# EAGLE design ide1-a (EAGLE 4.13)
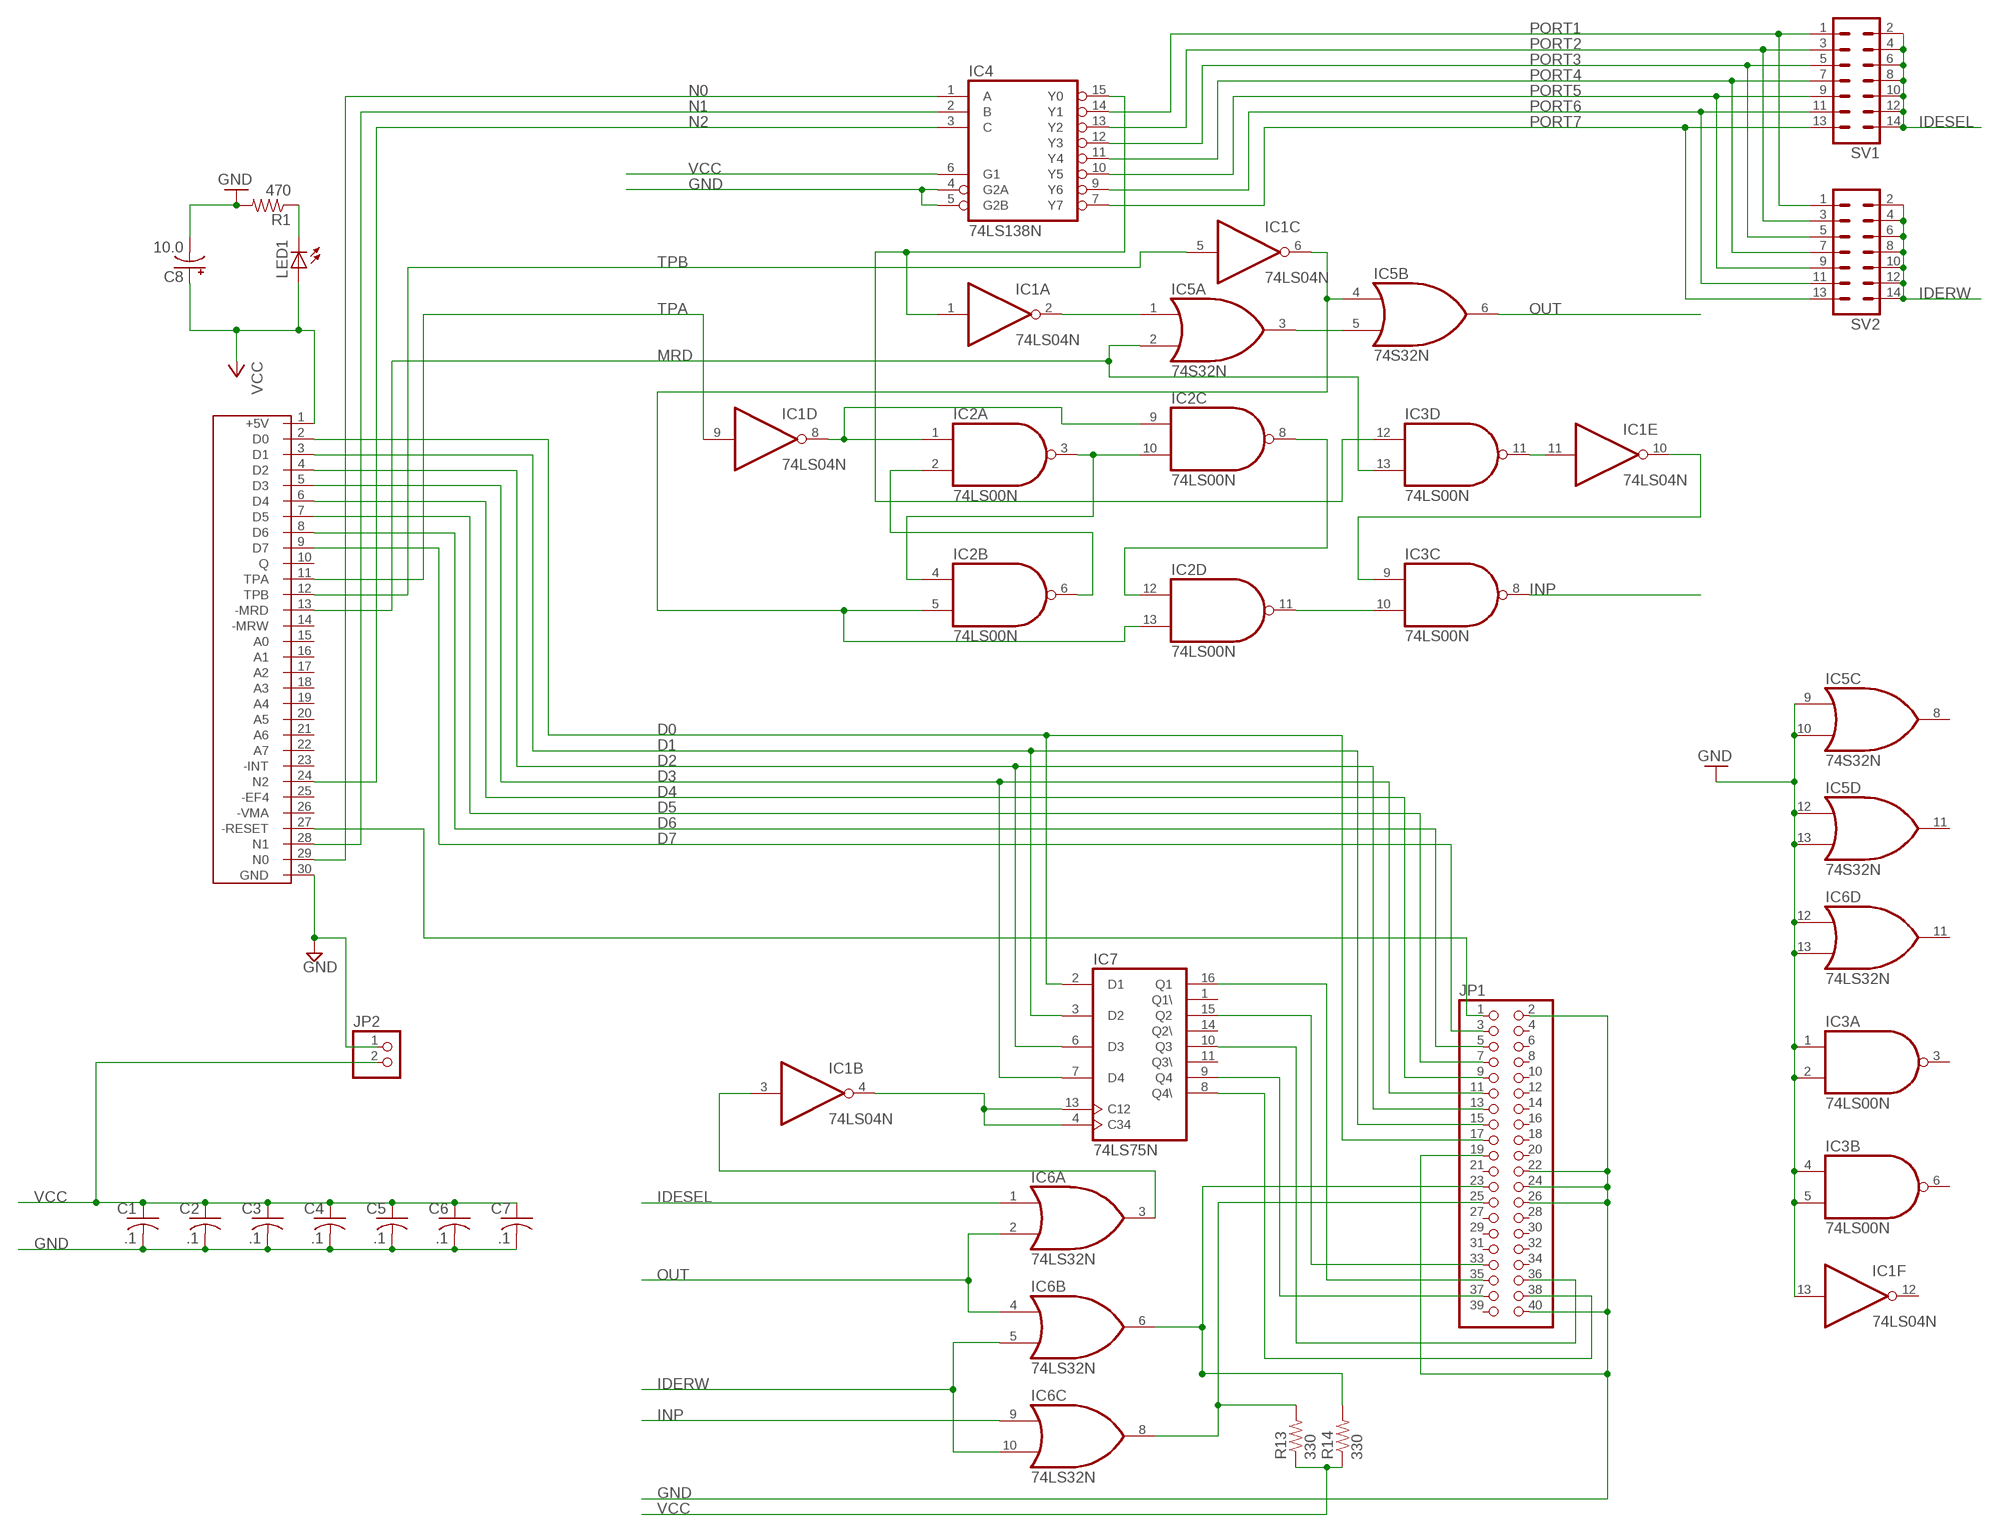
[diagram p0: schematic, sheet 1]

## Parts
C1  .1  C-US025-050X050  [C025-050X050]
C2  .1  C-US025-050X050  [C025-050X050]
C3  .1  C-US025-050X050  [C025-050X050]
C4  .1  C-US025-050X050  [C025-050X050]
C5  .1  C-US025-050X050  [C025-050X050]
C6  .1  C-US025-050X050  [C025-050X050]
C7  .1  C-US025-050X050  [C025-050X050]
C8  10.0  CPOL-USE2.5-7  [E2,5-7]
IC1  74LS04N  [DIL14]
IC2  74LS00N  [DIL14]
IC3  74LS00N  [DIL14]
IC4  74LS138N  [DIL16]
IC5  74S32N  [DIL14]
IC6  74LS32N  [DIL14]
IC7  74LS75N  [DIL16]
JP1  PINHD-2X20  [2X20]
JP2  PINHD-1X2  [1X02]
LED1  LED5MM  [LED5MM]
R1  470  R-US_0207/7  [0207/7]
R13  330  R-US_0207/7  [0207/7]
R14  330  R-US_0207/7  [0207/7]
SV1  MA07-2  [MA07-2]
SV2  MA07-2  [MA07-2]
U$1  C30  [C30]

## Nets
D0: IC7.2(D1) JP1.17 U$1.2(D0)
D1: IC7.3(D2) JP1.15 U$1.3(D1)
D2: IC7.6(D3) JP1.13 U$1.4(D2)
D3: IC7.7(D4) JP1.11 U$1.5(D3)
D4: JP1.9 U$1.6(D4)
D5: JP1.7 U$1.7(D5)
D6: JP1.5 U$1.8(D6)
D7: JP1.3 U$1.9(D7)
GND: C1.2 C2.2 C3.2 C4.2 C5.2 C6.2 C7.2 C8.- IC1.13(F:I) IC3.1(A:I0) IC3.2(A:I1) IC3.4(B:I0) IC3.5(B:I1) IC4.4(G2A) IC4.5(G2B) IC5.9(C:I0) IC5.10(C:I1) IC5.12(D:I0) IC5.13(D:I1) IC6.12(D:I0) IC6.13(D:I1) JP1.2 JP1.19 JP1.22 JP1.24 JP1.26 JP1.40 JP2.1 R1.2 U$1.30(GND)
IDERW: IC6.5(B:I1) IC6.10(C:I1) SV2.2 SV2.4 SV2.6 SV2.8 SV2.10 SV2.12 SV2.14
IDESEL: IC6.1(A:I0) SV1.2 SV1.4 SV1.6 SV1.8 SV1.10 SV1.12 SV1.14
INP: IC3.8(C:O) IC6.9(C:I0)
MRD: IC3.13(D:I1) IC5.2(A:I1) U$1.13(-MRD)
N0: IC4.1(A) U$1.29(N0)
N1: IC4.2(B) U$1.28(N1)
N2: IC4.3(C) U$1.24(N2)
N$6: IC1.1(A:I) IC3.12(D:I0) IC4.15(Y0)
N$7: IC1.2(A:O) IC5.1(A:I0)
N$8: IC2.3(A:O) IC2.4(B:I0) IC2.10(C:I1)
N$9: IC5.3(A:O) IC5.5(B:I1)
N$10: IC1.6(C:O) IC2.5(B:I1) IC2.13(D:I1) IC5.4(B:I0)
N$11: IC2.2(A:I1) IC2.6(B:O)
N$12: IC1.8(D:O) IC2.1(A:I0) IC2.9(C:I0)
N$13: IC1.10(E:O) IC3.9(C:I0)
N$14: IC2.8(C:O) IC2.12(D:I0)
N$15: IC1.3(B:I) IC6.3(A:O)
N$16: IC2.11(D:O) IC3.10(C:I1)
N$17: IC1.11(E:I) IC3.11(D:O)
N$22: LED1.K(C) R1.1
N$23: IC1.4(B:O) IC7.4(C34) IC7.13(C12)
N$24: IC7.16(Q1) JP1.35
N$25: IC7.15(Q2) JP1.33
N$26: IC7.10(Q3) JP1.36
N$27: IC7.9(Q4) JP1.37
N$28: IC7.8(Q4\) JP1.38
N$29: IC6.6(B:O) JP1.23 R14.2
N$30: IC6.8(C:O) JP1.25 R13.2
OUT: IC5.6(B:O) IC6.2(A:I1) IC6.4(B:I0)
PORT1: IC4.14(Y1) SV1.1 SV2.1
PORT2: IC4.13(Y2) SV1.3 SV2.3
PORT3: IC4.12(Y3) SV1.5 SV2.5
PORT4: IC4.11(Y4) SV1.7 SV2.7
PORT5: IC4.10(Y5) SV1.9 SV2.9
PORT6: IC4.9(Y6) SV1.11 SV2.11
PORT7: IC4.7(Y7) SV1.13 SV2.13
RESET: JP1.1 U$1.27(-RESET)
TPA: IC1.9(D:I) U$1.11(TPA)
TPB: IC1.5(C:I) U$1.12(TPB)
VCC: C1.1 C2.1 C3.1 C4.1 C5.1 C6.1 C7.1 C8.+ IC4.6(G1) JP2.2 LED1.A R13.1 R14.1 U$1.1(+5V)
Unconnected: IC1.12(F:O) IC3.3(A:O) IC3.6(B:O) IC5.8(C:O) IC5.11(D:O) IC6.11(D:O) IC7.1(Q1\) IC7.11(Q3\) IC7.14(Q2\) JP1.4 JP1.6 JP1.8 JP1.10 JP1.12 JP1.14 JP1.16 JP1.18 JP1.20 JP1.21 JP1.27 JP1.28 JP1.29 JP1.30 JP1.31 JP1.32 JP1.34 JP1.39 U$1.10(Q) U$1.14(-MRW) U$1.15(A0) U$1.16(A1) U$1.17(A2) U$1.18(A3) U$1.19(A4) U$1.20(A5) U$1.21(A6) U$1.22(A7) U$1.23(-INT) U$1.25(-EF4) U$1.26(-VMA)

## Power pins joined to a net without a drawn wire
GND: IC1.7(P:GND) IC2.7(P:GND) IC3.7(P:GND) IC4.8(GND) IC5.7(P:GND) IC6.7(P:GND) IC7.12(GND)
VCC: IC1.14(P:VCC) IC2.14(P:VCC) IC3.14(P:VCC) IC4.16(VCC) IC5.14(P:VCC) IC6.14(P:VCC) IC7.5(VCC)

## Library data of the parts
C1-C7 = rcl:C-US: CAPACITOR, American symbol
C8 = rcl:CPOL-US: POLARIZED CAPACITOR, American symbol
IC1 = 74xx-us:74*04: Hex INVERTER
IC2 IC3 = 74xx-us:74*00: Quad 2-input NAND gate
IC4 = 74xx-us:74*138: 3-line to 8-line DECODER/DEMULTIPLEXER
IC5 IC6 = 74xx-us:74*32: Quad 2-input OR gate
IC7 = 74xx-us:74*75: 4-bit bistable LATCH
JP1 = pinhead:PINHD-2X20: PIN HEADER
JP2 = pinhead:PINHD-1X2: PIN HEADER
LED1 = led:LED: LED OSRAM: - CHIPLED LG R971, LG N971, LY N971, LG Q971, LY Q971, LO R971, LY R971 LH N974, LH R974 LS Q976, LO Q976, LY Q976 LO Q996 - Hyper CHIPLED LW Q18S LB Q993, LB Q99A, LB R99A - SideLED LS A670, LO A670, LY A670, LG A670, LP A670 LB A673, LV A673, LT A673, LW A673 LH A674 LY A675 LS A676, LA A676, LO A676, LY A676, LW A676 LS A679, LY A679, LG A679 - Hyper Micro SIDELED® LS Y876, LA Y876, LO Y876, LY Y876 LT Y87S - SmartLED LW L88C, LW L88S LB L89C, LB L89S, LG L890 LS L89K, LO L89K, LY L89K LS L896, LA L896, LO L896, LY L896 - TOPLED LS T670, LO T670, LY T670, LG T670, LP T670 LSG T670, LSP T670, LSY T670, LOP T670, LYG T670 LG T671, LOG T671, LSG T671 LB T673, LV T673, LT T673, LW T673 LH T674 LS T676, LA T676, LO T676, LY T676, LB T676, LH T676, LSB T676, LW T676 LB T67C, LV T67C, LT T67C, LS T67K, LO T67K, LY T67K, LW E67C LS E67B, LA E67B, LO E67B, LY E67B, LB E67C, LV E67C, LT E67C LW T67C LS T679, LY T679, LG T679 LS T770, LO T770, LY T770, LG T770, LP T770 LB T773, LV T773, LT T773, LW T773 LH T774 LS E675, LA E675, LY E675, LS T675 LS T776, LA T776, LO T776, LY T776, LB T776 LHGB T686 LT T68C, LB T68C - Hyper Mini TOPLED® LB M676 - Mini TOPLED Santana® LG M470 LS M47K, LO M47K, LY M47K Source: http://www.osram.convergy.de/
R1 R13 R14 = rcl:R-US_: RESISTOR, American symbol
SV1 SV2 = con-lstb:MA07-2: PIN HEADER
U$1 = k1:C30

## Board
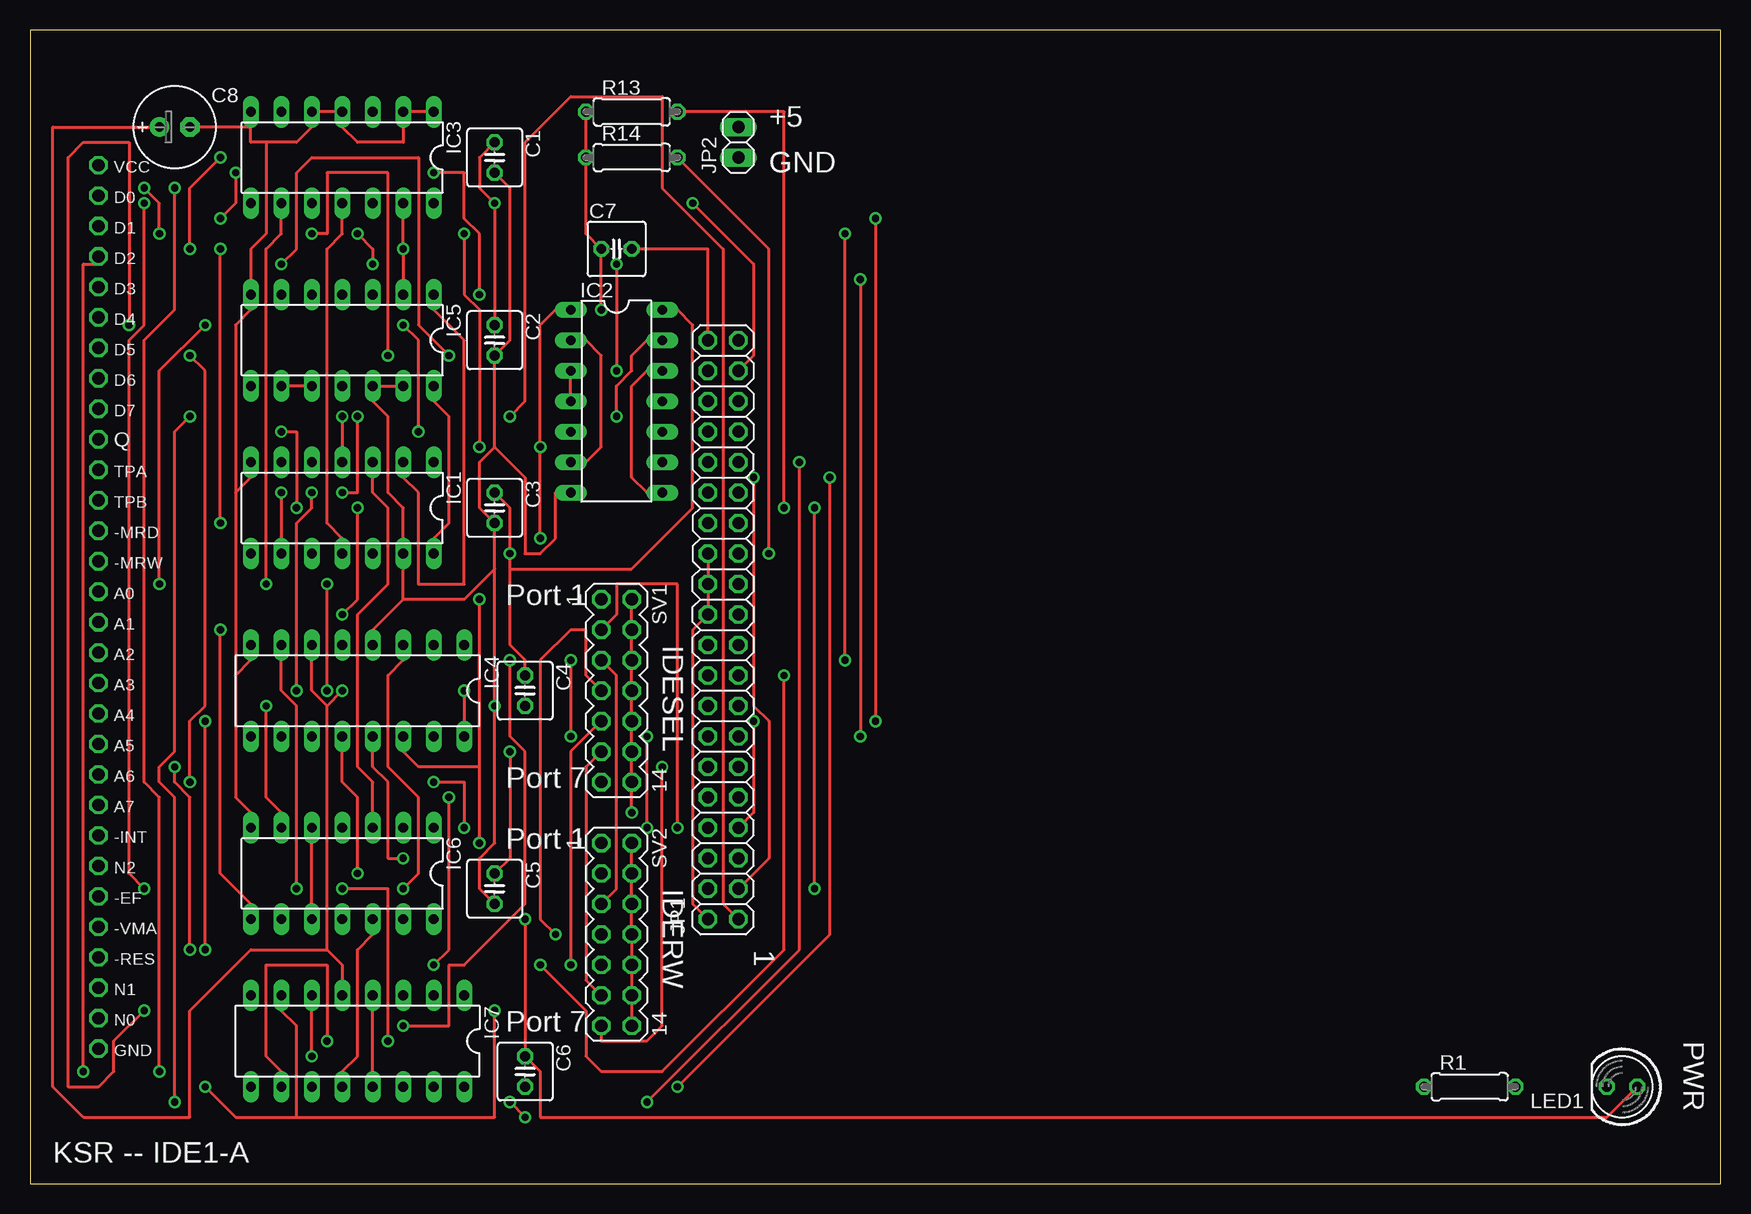
[diagram p1: board, top side]
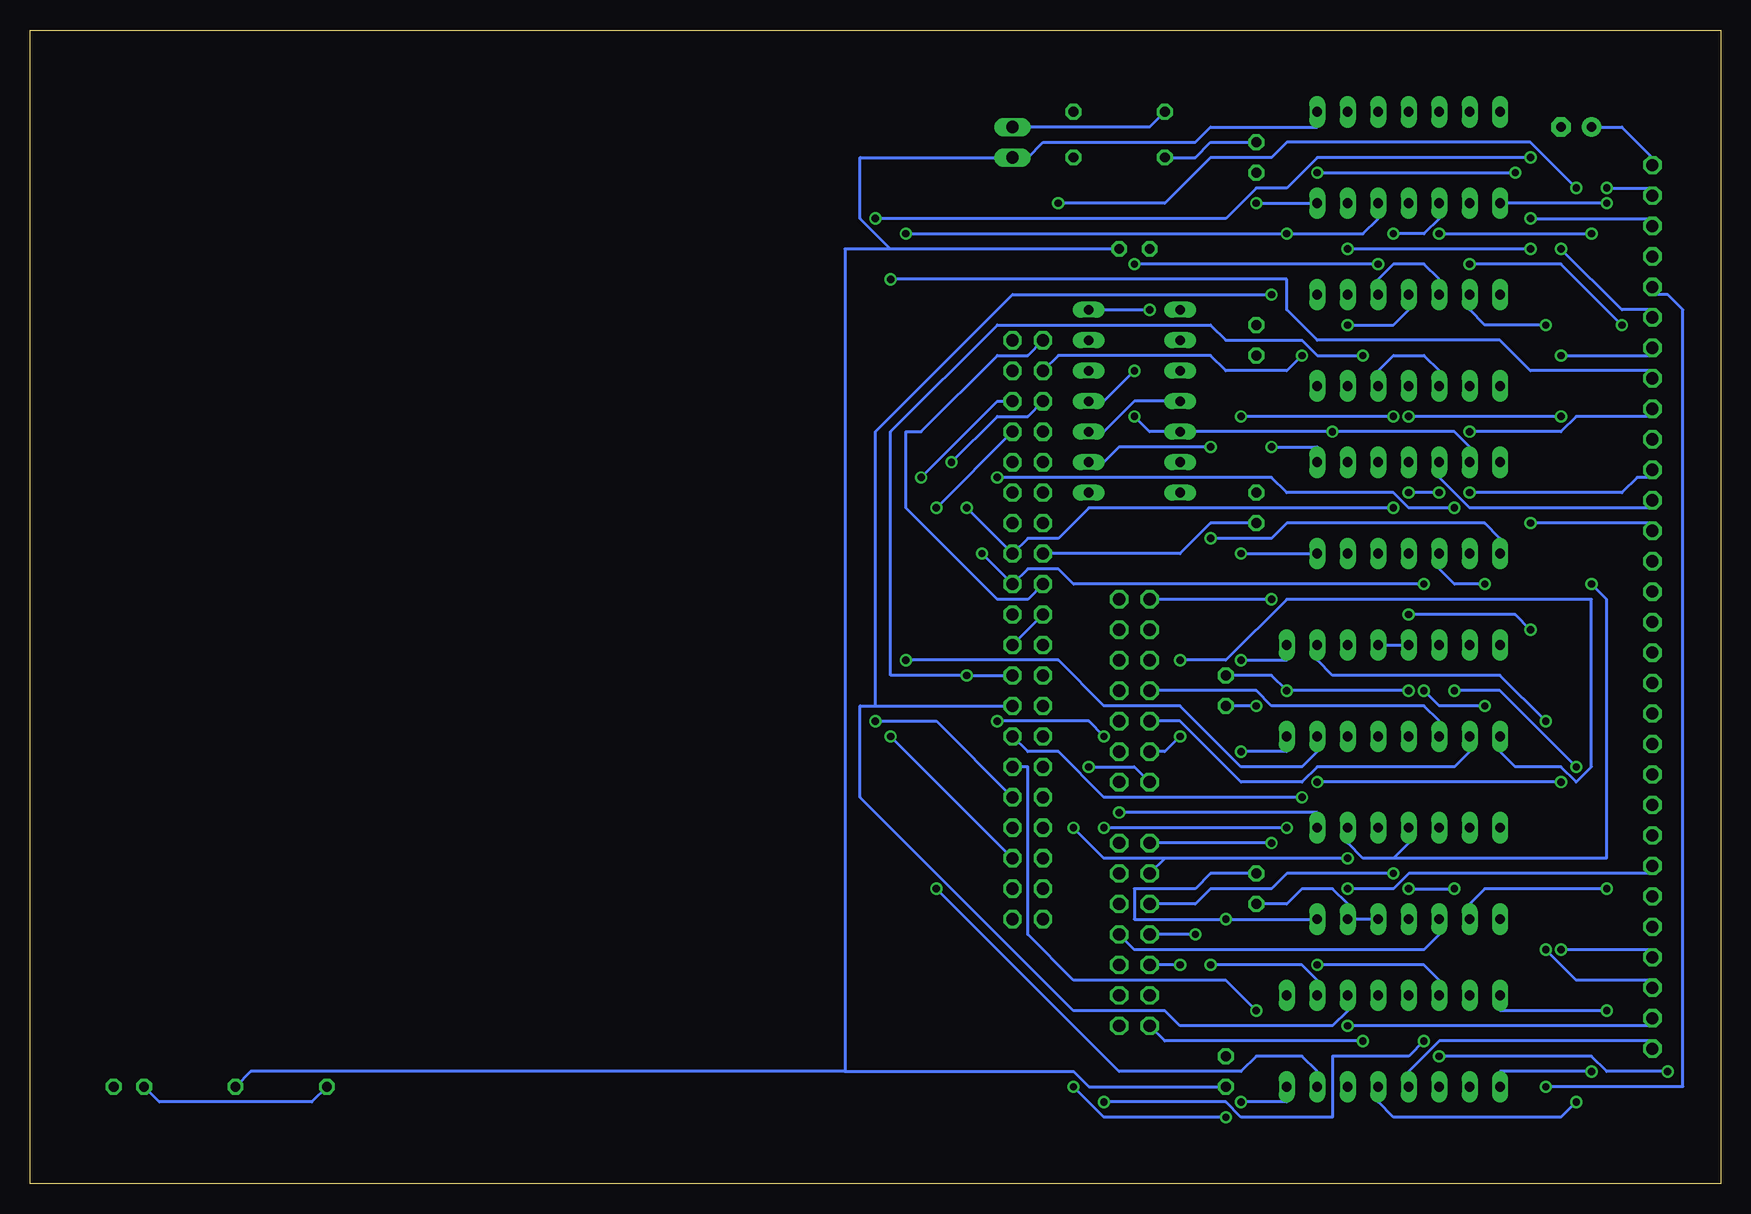
[diagram p2: board, bottom side, seen from below]

Size 140.95 x 96.19 mm. Coordinates in mm from the lower left corner, seen from the top.
Outline: 0,0 140.95,0 140.95,96.19 0,96.19 0,0
Copper layers (1*16): Top 0.035mm / dielectric 1.5mm / Bottom 0.035mm
Design rules "default": minimum track width 10mil, minimum drill 24mil, track to track 8mil, track to pad 8mil, pad to pad 8mil, via to via 8mil, smd to smd 8mil, copper to edge 40mil, drill to drill 8mil, minimum pad ring 10mil, minimum via ring 8mil, stop-mask expansion 4mil, vias tented up to drill 0mil, thermal gap 10mil
tRestrict: area 0.6,91.9 to 69.2,95.7; area 0.6,0.5 to 76.8,4.3
bRestrict: area 0.6,91.9 to 69.2,95.7; area 0.6,0.5 to 76.8,4.3

### Footprints (pad centres in the part's own frame; a part is rotated, then mirrored left to right if it is on the bottom)
C025-050X050 = drill 0.813 octagon: 1 -1.27,0; 2 1.27,0
E2,5-7 = drill 0.813 pad 1.6 round: + -1.27,0 | drill 0.813 pad 1.6 octagon: - 1.27,0
DIL14 = drill 0.813 long: 1 -7.62,-3.81; 2 -5.08,-3.81; 3 -2.54,-3.81; 4 0,-3.81; 5 2.54,-3.81; 6 5.08,-3.81; 7 7.62,-3.81; 8 7.62,3.81; 9 5.08,3.81; 10 2.54,3.81; 11 0,3.81; 12 -2.54,3.81; 13 -5.08,3.81; 14 -7.62,3.81
DIL16 = drill 0.813 long: 1 -8.89,-3.81; 2 -6.35,-3.81; 3 -3.81,-3.81; 4 -1.27,-3.81; 5 1.27,-3.81; 6 3.81,-3.81; 7 6.35,-3.81; 8 8.89,-3.81; 9 8.89,3.81; 10 6.35,3.81; 11 3.81,3.81; 12 1.27,3.81; 13 -1.27,3.81; 14 -3.81,3.81; 15 -6.35,3.81; 16 -8.89,3.81
2X20 = drill 1.016 octagon: 1 -24.13,-1.27; 2 -24.13,1.27; 3 -21.59,-1.27; 4 -21.59,1.27; 5 -19.05,-1.27; 6 -19.05,1.27; 7 -16.51,-1.27; 8 -16.51,1.27; 9 -13.97,-1.27; 10 -13.97,1.27; 11 -11.43,-1.27; 12 -11.43,1.27; 13 -8.89,-1.27; 14 -8.89,1.27; 15 -6.35,-1.27; 16 -6.35,1.27; 17 -3.81,-1.27; 18 -3.81,1.27; 19 -1.27,-1.27; 20 -1.27,1.27; 21 1.27,-1.27; 22 1.27,1.27; 23 3.81,-1.27; 24 3.81,1.27; 25 6.35,-1.27; 26 6.35,1.27; 27 8.89,-1.27; 28 8.89,1.27; 29 11.43,-1.27; 30 11.43,1.27; 31 13.97,-1.27; 32 13.97,1.27; 33 16.51,-1.27; 34 16.51,1.27; 35 19.05,-1.27; 36 19.05,1.27; 37 21.59,-1.27; 38 21.59,1.27; 39 24.13,-1.27; 40 24.13,1.27
1X02 = drill 1.016 long: 1 -1.27,0; 2 1.27,0
LED5MM = drill 0.813 octagon: A -1.27,0; K 1.27,0
0207/7 = drill 0.813 octagon: 1 -3.81,0; 2 3.81,0
MA07-2 = drill 1.016 octagon: 1 -7.62,-1.27; 2 -7.62,1.27; 3 -5.08,-1.27; 4 -5.08,1.27; 5 -2.54,-1.27; 6 -2.54,1.27; 7 0,-1.27; 8 0,1.27; 9 2.54,-1.27; 10 2.54,1.27; 11 5.08,-1.27; 12 5.08,1.27; 13 7.62,-1.27; 14 7.62,1.27
C30 = drill 1.016 octagon: 1 -36.83,0; 2 -34.29,0; 3 -31.75,0; 4 -29.21,0; 5 -26.67,0; 6 -24.13,0; 7 -21.59,0; 8 -19.05,0; 9 -16.51,0; 10 -13.97,0; 11 -11.43,0; 12 -8.89,0; 13 -6.35,0; 14 -3.81,0; 15 -1.27,0; 16 1.27,0; 17 3.81,0; 18 6.35,0; 19 8.89,0; 20 11.43,0; 21 13.97,0; 22 16.51,0; 23 19.05,0; 24 21.59,0; 25 24.13,0; 26 26.67,0; 27 29.21,0; 28 31.75,0; 29 34.29,0; 30 36.83,0

### Placement (x,y rotation side)
C1  38.73,85.56 270 top
C2  38.73,70.32 270 top
C3  38.73,56.35 270 top
C4  41.27,41.11 270 top
C5  38.73,24.6 270 top
C6  41.27,9.36 270 top
C7  48.89,77.94 0 top
C8  12.06,88.1 0 top
IC1  26.03,56.35 180 top
IC2  48.89,65.24 270 top
IC3  26.03,85.56 180 top
IC4  27.3,41.11 180 top
IC5  26.03,70.32 180 top
IC6  26.03,25.87 180 top
IC7  27.3,11.9 180 top
JP1  57.78,46.19 90 top
JP2  59.05,86.83 90 top
LED1  132.71,8.09 180 top
R1  120.01,8.09 0 top
R13  50.16,89.37 0 top
R14  50.16,85.56 0 top
SV1  48.89,41.11 270 top
SV2  48.89,20.79 270 top
U$1  5.71,48.09 270 top

### Tracks (layer width: path | path; a pad name or v marks a point on that pad's centre or on a via)
D0  (via drill 0.61)
  Top 0.254: v42.54,18.25 46.35,14.44 46.35,10.63 47.62,9.36 52.7,9.36 62.86,19.52 v62.86,42.38 | v9.52,83.02 10.79,81.75 v10.79,79.21 | v23.49,79.21 24.76,79.21 24.76,84.29 29.84,84.29 v29.84,69.05
  Bottom 0.254: v42.54,18.25 34.92,18.25 33.65,16.98 IC7.2 | JP1.17 v62.86,42.38 69.21,42.38 69.21,62.7 60.32,71.59 42.54,71.59 41.27,70.32 34.92,70.32 33.65,69.05 v29.84,69.05 | v9.52,83.02 5.71,83.02 U$1.2 | v23.49,79.21 v10.79,79.21
D1  (via drill 0.61)
  Top 0.254: v15.87,80.48 17.14,81.75 v17.14,84.29 | v33.65,84.29 36.19,84.29 36.19,80.48 37.46,79.21 v37.46,74.13
  Bottom 0.254: 70.48,39.84 JP1.15 | 70.48,39.84 71.75,39.84 71.75,32.22 53.97,14.44 46.35,14.44 45.08,13.17 32.38,13.17 31.11,14.44 IC7.3 | v15.87,80.48 5.71,80.48 U$1.3 | v33.65,84.29 v17.14,84.29 | v37.46,74.13 59.05,74.13 70.48,62.7 70.48,39.84
D2  (via drill 0.61)
  Top 0.254: v33.65,18.25 34.92,19.52 v34.92,32.22 | v4.44,9.36 4.44,76.67 5.71,76.67 U$1.4 | v23.49,10.63 IC7.6
  Bottom 0.254: v33.65,18.25 24.76,18.25 23.49,16.98 IC7.6 | v34.92,32.22 51.43,32.22 55.24,36.03 57.78,36.03 JP1.13 | v4.44,9.36 9.52,9.36 10.79,10.63 v23.49,10.63
D3  (via drill 0.61)
  Top 0.254: 22.22,5.55 22.22,13.17 20.95,14.44 IC7.7 | 22.22,5.55 38.73,5.55 v38.73,14.44 | v14.6,8.09 17.14,5.55 22.22,5.55
  Bottom 0.254: v38.73,14.44 41.27,16.98 53.97,16.98 57.78,20.79 57.78,34.76 JP1.11 | v14.6,8.09 3.17,8.09 3.17,72.86 4.44,74.13 5.71,74.13 U$1.5
D4  (via drill 0.61)
  Top 0.254: v70.48,80.48 v70.48,38.57 | v15.87,85.56 13.33,83.02 v13.33,77.94
  Bottom 0.254: JP1.9 65.4,38.57 v70.48,38.57 | v70.48,80.48 41.27,80.48 38.73,83.02 36.19,83.02 33.65,85.56 v15.87,85.56 | v13.33,77.94 8.25,72.86 5.71,72.86 U$1.6
D5  (via drill 0.61)
  Top 0.254: v13.33,69.05 14.6,67.78 14.6,39.84 13.33,38.57 v13.33,33.49 | v33.65,33.49 36.19,33.49 v36.19,29.68 | v51.43,29.68 v51.43,37.3 | v60.32,38.57 60.32,30.95 JP1.7
  Bottom 0.254: v13.33,69.05 5.71,69.05 U$1.7 | v13.33,33.49 v33.65,33.49 | v36.19,29.68 v51.43,29.68 | v51.43,37.3 52.7,38.57 v60.32,38.57
D6  (via drill 0.61)
  Top 0.254: v69.21,75.4 v69.21,37.3
  Bottom 0.254: v69.21,75.4 36.19,75.4 36.19,72.86 33.65,70.32 18.41,70.32 15.87,67.78 5.71,67.78 U$1.8 | v69.21,37.3 JP1.5
D7  (via drill 0.61)
  Top 0.254: v20.95,62.7 22.22,62.7 v22.22,56.35 | v60.32,58.89 60.32,39.84 61.59,38.57 61.59,27.14 JP1.3
  Bottom 0.254: v20.95,62.7 13.33,62.7 12.06,63.97 5.71,63.97 U$1.9 | v22.22,56.35 26.03,56.35 27.3,57.62 36.19,57.62 37.46,58.89 v60.32,58.89
GND  (via drill 0.61)
  Top 0.254: IC6.12 28.57,20.79 27.3,19.52 27.3,10.63 26.03,9.36 IC7.12 | JP1.26 JP1.24 JP1.22 55.24,46.19 55.24,23.33 JP1.2 | IC5.10 IC5.9 | IC5.13 IC5.12 28.57,65.24 29.84,63.97 29.84,57.62 31.11,56.35 IC1.13 31.11,48.73 | 31.11,48.73 28.57,46.19 IC4.4 | 38.73,61.43 37.46,60.16 37.46,56.35 C3.2 38.73,51.27 | 38.73,61.43 C2.2 40,70.32 40,83.02 C1.2 | 38.73,51.27 v38.73,39.84 38.73,28.41 37.46,27.14 37.46,24.6 C5.2 | 38.73,61.43 41.27,58.89 41.27,52.54 42.54,52.54 43.81,53.81 43.81,57.62 IC2.7 | 31.11,48.73 36.19,48.73 38.73,51.27 | 17.14,42.38 17.14,32.22 18.41,30.95 IC6.7 | 17.14,42.38 18.41,43.65 IC4.8 | 17.14,57.62 18.41,58.89 IC1.7 | 17.14,57.62 17.14,42.38 | 17.14,57.62 17.14,71.59 18.41,72.86 IC5.7 18.41,77.94 19.68,79.21 19.68,86.83 | 18.41,88.1 C8.- | 19.68,86.83 18.41,86.83 18.41,88.1 | 19.68,86.83 22.22,86.83 23.49,88.1 IC3.5 IC3.4 26.03,88.1 27.3,86.83 31.11,86.83 IC3.2 IC3.1 | 18.41,88.1 IC3.7 | C7.2 56.51,77.94 JP1.40
  Bottom 0.254: IC6.12 IC6.13 31.11,23.33 32.38,24.6 34.92,24.6 36.19,23.33 C5.2 | IC7.12 26.03,9.36 23.49,11.9 5.71,11.9 U$1.30 | JP1.22 JP1.19 | IC5.10 23.49,67.78 24.76,69.05 27.3,69.05 28.57,67.78 IC5.12 | IC4.4 IC4.5 | v38.73,39.84 C4.2 | JP1.26 45.08,52.54 42.54,55.08 C3.2 | C6.2 52.7,8.09 53.97,9.36 73.02,9.36 | 73.02,9.36 122.55,9.36 R1.2 | IC3.1 33.65,88.1 42.54,88.1 43.81,86.83 56.51,86.83 57.78,85.56 JP2.1 71.75,85.56 71.75,80.48 69.21,77.94 | C7.2 69.21,77.94 | 73.02,9.36 73.02,77.94 69.21,77.94 | JP1.24 57.78,48.73 60.32,48.73 67.94,56.35 67.94,62.7 66.67,62.7 60.32,69.05 57.78,69.05 JP1.40
IDERW
  Top 0.254: IC6.10 IC6.5 | SV2.2 SV2.4 SV2.6 SV2.8 SV2.10 SV2.12 SV2.14
  Bottom 0.254: SV2.8 48.89,19.52 24.76,19.52 23.49,20.79 IC6.10
IDESEL  (via drill 0.61)
  Top 0.254: SV1.2 SV1.4 SV1.6 SV1.8 SV1.10 SV1.12 SV1.14 v50.16,30.95
  Bottom 0.254: v50.16,30.95 33.65,30.95 IC6.1
INP  (via drill 0.61)
  Top 0.254: v9.52,24.6 8.25,25.87 8.25,70.32 9.52,71.59 v9.52,81.75
  Bottom 0.254: v9.52,24.6 19.68,24.6 20.95,23.33 IC6.9 | v9.52,81.75 IC3.8
MRD  (via drill 0.61)
  Top 0.254: IC5.2 v31.11,77.94 IC3.13 | v15.87,55.08 v15.87,77.94
  Bottom 0.254: v15.87,55.08 5.71,55.08 U$1.13 | v15.87,77.94 v31.11,77.94
N0  (via drill 0.61)
  Top 0.254: v40,43.65 40,37.3 41.27,36.03 41.27,23.33 36.19,18.25 34.92,18.25 34.92,13.17 v31.11,13.17
  Bottom 0.254: v40,43.65 36.19,43.65 IC4.1 | v31.11,13.17 5.71,13.17 U$1.29
N1  (via drill 0.61)
  Top 0.254: v14.6,19.52 v14.6,38.57
  Bottom 0.254: v14.6,38.57 18.41,42.38 32.38,42.38 33.65,43.65 IC4.2 | v14.6,19.52 12.06,16.98 5.71,16.98 U$1.28
N2  (via drill 0.61)
  Top 0.254: v31.11,24.6 32.38,25.87 32.38,32.22 29.84,34.76 29.84,42.38 31.11,43.65 IC4.3
  Bottom 0.254: v31.11,24.6 27.3,24.6 26.03,25.87 5.71,25.87 U$1.24
N$6  (via drill 0.61)
  Top 0.254: v67.94,43.65 v67.94,79.21 | v37.46,61.43 37.46,72.86 36.19,74.13 v36.19,79.21
  Bottom 0.254: v67.94,43.65 55.24,43.65 51.43,39.84 45.08,39.84 40,34.76 34.92,34.76 33.65,36.03 IC4.15 | v67.94,79.21 v36.19,79.21 29.84,79.21 28.57,80.48 IC3.12 | v37.46,61.43 33.65,61.43 IC1.1
N$7
  Top 0.254: IC1.2 31.11,58.89 32.38,57.62 32.38,50 36.19,50 36.19,70.32 33.65,72.86 IC5.1
N$8
  Top 0.254: IC2.4 IC2.3
  Bottom 0.254: IC2.10 51.43,62.7 48.89,65.24 IC2.4
N$9
  Bottom 0.254: IC5.5 23.49,75.4 24.76,76.67 27.3,76.67 28.57,75.4 IC5.3
N$10  (via drill 0.61)
  Top 0.254: v31.11,71.59 32.38,70.32 v32.38,62.7 | v48.89,63.97 48.89,66.51 50.16,67.78 50.16,69.05 51.43,70.32 IC2.13
  Bottom 0.254: IC1.6 20.95,61.43 22.22,62.7 v32.38,62.7 IC2.5 47.62,62.7 v48.89,63.97 | v31.11,71.59 27.3,71.59 26.03,72.86 IC5.4
N$11
  Top 0.254: IC2.6 46.35,60.16 47.62,61.43 47.62,69.05 46.35,70.32 IC2.2
N$12  (via drill 0.61)
  Top 0.254: v42.54,53.81 v42.54,61.43 42.54,71.59 43.81,72.86 IC2.1
  Bottom 0.254: v42.54,53.81 37.46,53.81 36.19,55.08 19.68,55.08 18.41,53.81 IC1.8 | v42.54,61.43 50.16,61.43 51.43,60.16 IC2.9
N$13  (via drill 0.61)
  Top 0.254: v19.68,50 19.68,77.94 20.95,79.21 IC3.9
  Bottom 0.254: v19.68,50 22.22,50 23.49,51.27 IC1.10
N$14
  Top 0.254: IC2.8 51.43,57.62 50.16,58.89 50.16,66.51 51.43,67.78 IC2.12
N$15
  Top 0.254: IC6.3 28.57,33.49 27.3,34.76 27.3,47.46 29.84,50 29.84,56.35 28.57,57.62 IC1.3
N$16  (via drill 0.61)
  Top 0.254: v27.3,79.21 28.57,77.94 v28.57,76.67 | v48.89,76.67 v48.89,67.78
  Bottom 0.254: v27.3,79.21 24.76,79.21 23.49,80.48 IC3.10 | v28.57,76.67 v48.89,76.67 | v48.89,67.78 51.43,65.24 IC2.11
N$17
  Top 0.254: IC1.11 26.03,53.81 24.76,55.08 24.76,77.94 26.03,79.21 IC3.11
N$22
  Bottom 0.254: R1.1 117.47,6.82 130.17,6.82 LED1.K
N$23  (via drill 0.61)
  Top 0.254: IC7.13 IC7.4 | v13.33,63.97 12.06,62.7 12.06,36.03 10.79,34.76 10.79,33.49 12.06,32.22 v12.06,6.82 | v26.03,63.97 IC1.4
  Bottom 0.254: v13.33,63.97 v26.03,63.97 | v12.06,6.82 13.33,5.55 27.3,5.55 28.57,6.82 IC7.13
N$24  (via drill 0.61)
  Top 0.254: v40,6.82 v41.27,5.55 | v53.97,8.09 66.67,20.79 v66.67,58.89
  Bottom 0.254: v40,6.82 36.19,6.82 IC7.16 | v41.27,5.55 51.43,5.55 v53.97,8.09 | v66.67,58.89 60.32,65.24 JP1.35
N$25  (via drill 0.61)
  Top 0.254: v65.4,24.6 v65.4,56.35
  Bottom 0.254: v65.4,24.6 50.16,9.36 40,9.36 38.73,10.63 34.92,10.63 33.65,9.36 IC7.15 | v65.4,56.35 JP1.33
N$26  (via drill 0.61)
  Top 0.254: v24.76,11.9 24.76,18.25 19.68,18.25 19.68,10.63 20.95,9.36 IC7.10 | v51.43,6.82 64.13,19.52 v64.13,60.16
  Bottom 0.254: v24.76,11.9 26.03,10.63 32.38,10.63 32.38,5.55 40,5.55 41.27,6.82 v51.43,6.82 | v64.13,60.16 60.32,63.97 57.78,63.97 JP1.36
N$27  (via drill 0.61)
  Top 0.254: v10.79,9.36 10.79,32.22 9.52,33.49 9.52,70.32 12.06,72.86 v12.06,83.02 | v55.24,81.75 60.32,76.67 60.32,69.05 JP1.37
  Bottom 0.254: v10.79,9.36 18.41,9.36 IC7.9 | v12.06,83.02 15.87,86.83 36.19,86.83 37.46,85.56 42.54,85.56 46.35,81.75 v55.24,81.75
N$28  (via drill 0.61)
  Top 0.254: v9.52,14.44 6.98,11.9 6.98,9.36 5.71,8.09 3.17,8.09 3.17,85.56 4.44,86.83 8.25,86.83 v8.25,71.59 | v20.95,76.67 22.22,77.94 22.22,84.29 23.49,85.56 32.38,85.56 32.38,71.59 v34.92,69.05
  Bottom 0.254: v9.52,14.44 18.41,14.44 IC7.8 | v8.25,71.59 13.33,76.67 v20.95,76.67 | v34.92,69.05 36.19,67.78 41.27,67.78 42.54,69.05 55.24,69.05 JP1.38
N$29  (via drill 0.61)
  Top 0.254: v19.68,39.84 19.68,32.22 20.95,30.95 IC6.6 | v24.76,41.11 v24.76,50 | R14.2 61.59,77.94 v61.59,52.54
  Bottom 0.254: v19.68,39.84 23.49,39.84 v24.76,41.11 | v24.76,50 53.97,50 55.24,51.27 57.78,51.27 JP1.23 v61.59,52.54
N$30  (via drill 0.61)
  Top 0.254: v15.87,46.19 15.87,25.87 18.41,23.33 IC6.8 | v26.03,47.46 27.3,48.73 v27.3,56.35 | R13.2 62.86,89.37 v62.86,56.35
  Bottom 0.254: v15.87,46.19 17.14,47.46 v26.03,47.46 | v27.3,56.35 52.7,56.35 55.24,53.81 57.78,53.81 JP1.25 v62.86,56.35
OUT  (via drill 0.61)
  Top 0.254: v14.6,71.59 10.79,67.78 v10.79,50
  Bottom 0.254: 27.3,27.14 26.03,28.41 IC6.4 | 27.3,27.14 29.84,27.14 31.11,28.41 IC6.2 | v14.6,71.59 19.68,71.59 20.95,72.86 IC5.6 | v10.79,50 9.52,48.73 9.52,27.14 27.3,27.14
PORT1  (via drill 0.61)
  Top 0.254: 37.46,34.76 32.38,34.76 31.11,36.03 IC4.14 | v37.46,28.41 37.46,34.76 | 37.46,34.76 v37.46,48.73
  Bottom 0.254: v37.46,28.41 SV2.1 | v37.46,48.73 SV1.1
PORT2  (via drill 0.61)
  Top 0.254: v31.11,27.14 29.84,27.14 29.84,33.49 28.57,34.76 IC4.13 | SV1.3 48.89,47.46 48.89,50 53.97,50 v53.97,29.68
  Bottom 0.254: v31.11,27.14 46.35,27.14 | 46.35,27.14 SV2.3 | v53.97,29.68 51.43,27.14 46.35,27.14
PORT3  (via drill 0.61)
  Top 0.254: v27.3,25.87 27.3,32.22 26.03,33.49 IC4.12 | SV1.5 48.89,42.38 48.89,24.6 SV2.5
  Bottom 0.254: v27.3,25.87 36.19,25.87 37.46,24.6 42.54,24.6 43.81,23.33 SV2.5
PORT4  (via drill 0.61)
  Top 0.254: v43.81,20.79 42.54,22.06 42.54,43.65 45.08,46.19 46.35,46.19 46.35,42.38 SV1.7
  Bottom 0.254: SV1.7 38.73,41.11 37.46,39.84 24.76,39.84 23.49,38.57 IC4.11 | v43.81,20.79 SV2.7
PORT5  (via drill 0.61)
  Top 0.254: v45.08,18.25 45.08,36.03 SV1.9
  Bottom 0.254: SV1.9 45.08,38.57 40,33.49 34.92,33.49 33.65,34.76 22.22,34.76 20.95,36.03 IC4.10 | v45.08,18.25 SV2.9
PORT6  (via drill 0.61)
  Top 0.254: v45.08,43.65 v45.08,37.3 | SV2.11 46.35,16.98 46.35,34.76 SV1.11
  Bottom 0.254: v45.08,43.65 41.27,43.65 36.19,48.73 10.79,48.73 10.79,34.76 12.06,33.49 13.33,34.76 17.14,34.76 18.41,36.03 IC4.9 | v45.08,37.3 46.35,36.03 SV1.11
PORT7  (via drill 0.61)
  Top 0.254: v22.22,24.6 22.22,39.84 20.95,41.11 IC4.7 | v26.03,24.6 29.84,24.6 v29.84,11.9 | v52.7,34.76 52.7,13.17 51.43,11.9 47.62,11.9 SV2.13
  Bottom 0.254: v26.03,24.6 v22.22,24.6 | v29.84,11.9 46.35,11.9 SV2.13 | SV1.13 48.89,34.76 v52.7,34.76
RESET  (via drill 0.61)
  Top 0.254: v13.33,19.52 13.33,32.22 12.06,33.49 v12.06,34.76 | v22.22,41.11 22.22,55.08 23.49,56.35 v23.49,57.62 | v26.03,57.62 27.3,57.62 v27.3,63.97 | v40,63.97 41.27,65.24 41.27,86.83 45.08,90.64 52.7,90.64 52.7,83.02 57.78,77.94 57.78,23.33 JP1.1
  Bottom 0.254: v13.33,19.52 5.71,19.52 U$1.27 | v12.06,34.76 18.41,41.11 v22.22,41.11 | v23.49,57.62 v26.03,57.62 | v27.3,63.97 v40,63.97
TPA  (via drill 0.61)
  Top 0.254: v20.95,57.62 IC1.9
  Bottom 0.254: v20.95,57.62 8.25,57.62 6.98,58.89 5.71,58.89 U$1.11
TPB
  Bottom 0.254: IC1.5 23.49,58.89 20.95,56.35 5.71,56.35 U$1.12
VCC  (via drill 0.61)
  Top 0.254: v41.27,22.06 C6.1 42.54,9.36 42.54,5.55 131.44,5.55 LED1.A | C2.1 v38.73,81.75 37.46,83.02 37.46,85.56 C1.1 | R13.1 R14.1 46.35,79.21 C7.1 v47.62,72.86 | IC1.14 33.65,53.81 34.92,55.08 34.92,63.97 33.65,65.24 IC5.14 | v36.19,41.11 IC4.16 | C3.1 40,56.35 v40,52.54 40,51.27 | 40,51.27 40,44.92 41.27,43.65 C4.1 | 40,51.27 50.16,51.27 55.24,56.35 55.24,71.59 53.97,72.86 IC2.14 | 24.76,19.52 26.03,18.25 IC7.5 | 24.76,19.52 24.76,39.84 | 24.76,39.84 23.49,41.11 IC4.6 | C8.+ 1.9,88.1 1.9,8.09 4.44,5.55 13.33,5.55 13.33,14.44 18.41,19.52 24.76,19.52 | 24.76,39.84 v26.03,41.11 | C5.1 40,27.14 v40,36.03
  Bottom 0.254: IC6.14 v41.27,22.06 48.89,22.06 48.89,24.6 43.81,24.6 42.54,25.87 C5.1 | v38.73,81.75 IC3.14 | R13.1 47.62,88.1 JP2.2 | C1.1 42.54,86.83 43.81,85.56 R14.1 | C4.1 37.46,42.38 v36.19,41.11 v26.03,41.11 | v40,52.54 IC1.14 | IC2.14 v47.62,72.86 | C8.+ 8.25,88.1 5.71,85.56 U$1.1 | v40,36.03 36.19,36.03 IC4.16

### Text on the board
tNames: +5 | GND | Port 1 | IDESEL | Port 7 | Port 1 | IDERW | 1 | Port 7 | PWR | KSR -- IDE1-A